# Altium schematic sheet TS808.SchDoc
size 381 x 152 mm
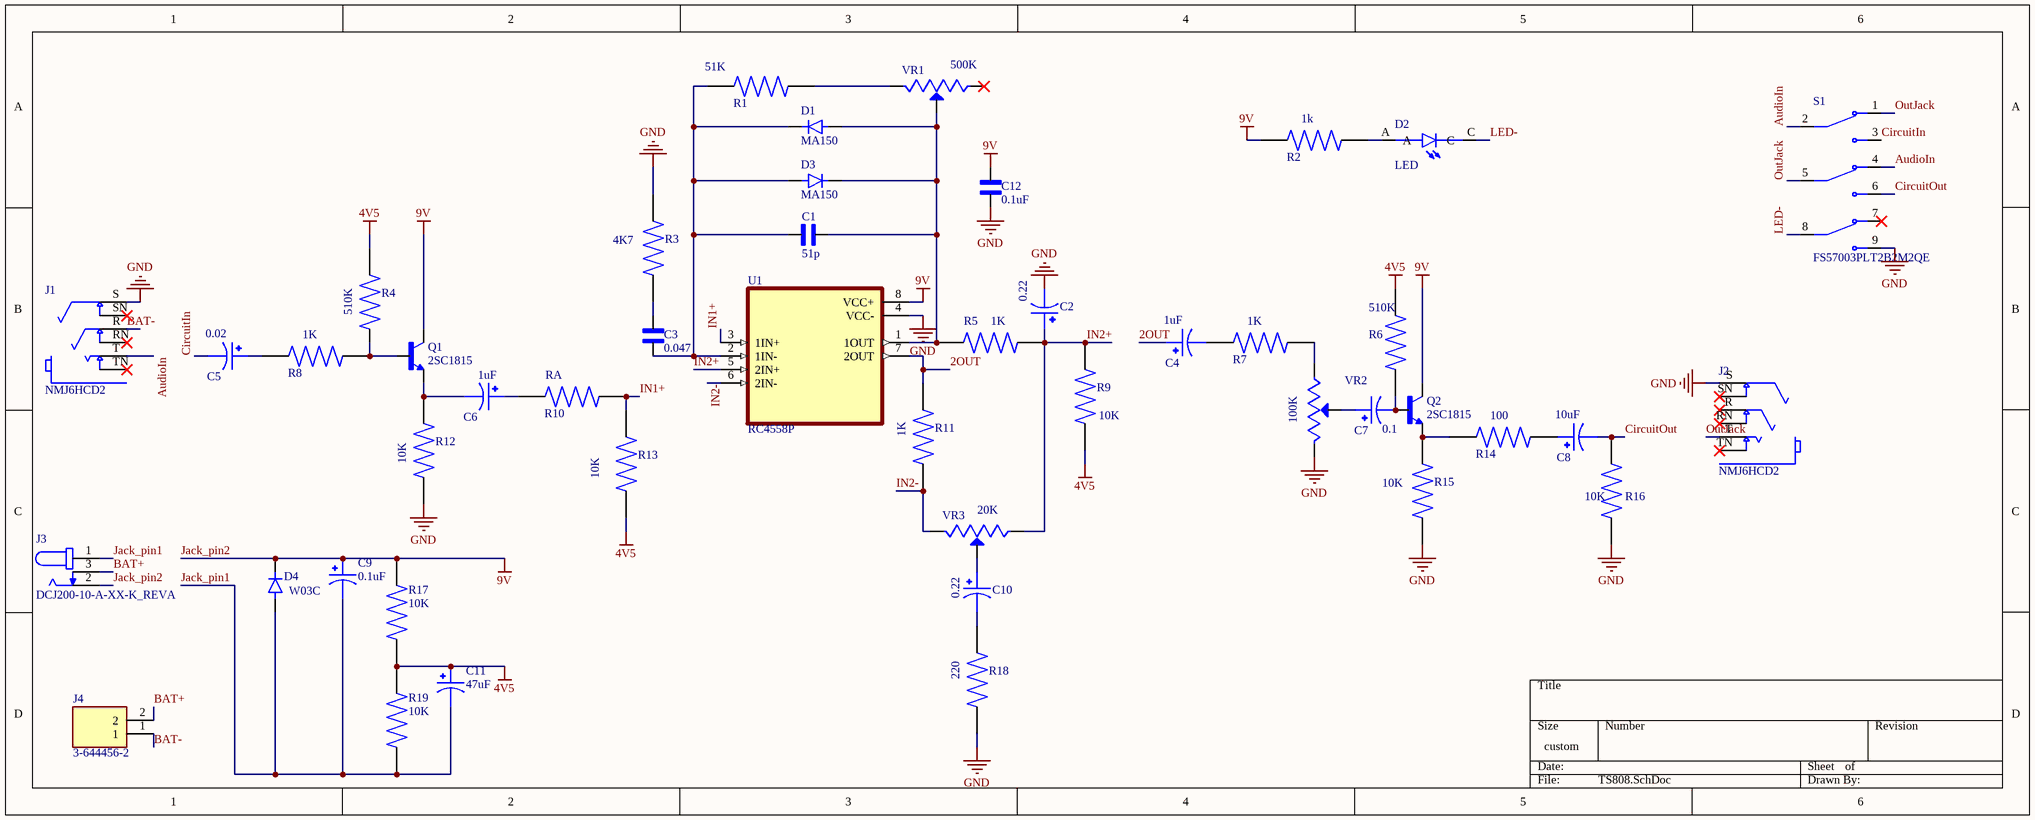
[diagram p0: TS808.SchDoc]

## Parts
C1  51p  [CAPRB500W50L400T250H550]
C2  0.22  [CAPPRD200W50D550H1250]
C3  0.047  [CAPRB500W50L400T250H550]
C4  1uF  [CAPPRD200W50D550H1250]
C5  0.02  [CAPPRD200W50D550H1250]
C6  1uF  [CAPPRD200W50D550H1250]
C7  0.1  [CAPPRD200W50D550H1250]
C8  10uF  [CAPPRD200W50D550H1250]
C9  0.1uF  [CAPPRD200W50D550H1250]
C10  0.22  [CAPPRD200W50D550H1250]
C11  47uF  [CAPPRD200W50D550H1250]
C12  0.1uF  [CAPRB500W50L400T250H550]
D1  MA150  [DIOAD1036W78L470D235]
D2  LED  [LED_WP7113ID]
D3  MA150  [DIOAD1036W78L470D235]
D4  W03C  [DIOAD1036W78L470D235]
J1  NMJ6HCD2  [NEUTRIK_NMJ6HCD2]
J2  NMJ6HCD2  [NEUTRIK_NMJ6HCD2]
J3  DCJ200-10-A-XX-K_REVA  [GCT_DCJ200-10-A-XX-K_REVA]
J4  3-644456-2  [TE_3-644456-2]
Q1  2SC1815  [TO92]
Q2  2SC1815  [TO92]
R1  51K  [RESAD1100W55L680D260]
R2  1k  [RESAD1100W55L680D260]
R3  4K7  [RESAD1100W55L680D260]
R4  510K  [RESAD1100W55L680D260]
R5  1K  [RESAD1100W55L680D260]
R6  510K  [RESAD1100W55L680D260]
R7  1K  [RESAD1100W55L680D260]
R8  1K  [RESAD1100W55L680D260]
R9  10K  [RESAD1100W55L680D260]
R10  RA  [RESAD1100W55L680D260]
R11  1K  [RESAD1100W55L680D260]
R12  10K  [RESAD1100W55L680D260]
R13  10K  [RESAD1100W55L680D260]
R14  100  [RESAD1100W55L680D260]
R15  10K  [RESAD1100W55L680D260]
R16  10K  [RESAD1100W55L680D260]
R17  10K  [RESAD1100W55L680D260]
R18  220  [RESAD1100W55L680D260]
R19  10K  [RESAD1100W55L680D260]
S1  FS57003PLT2B2M2QE  [SW_FS57003PLT2B2M2QE]
U1  RC4558P  [DIP794W45P254L959H508Q8]
VR1  500K  [TRIM_3296W-1-101LF]
VR2  100K  [TRIM_3296W-1-101LF]
VR3  20K  [TRIM_3296W-1-101LF]

## Nets
4V5: C11.1 R4.1 R6.1 R9.2 R13.2 R17.1 R19.2
GND: C2.2 C12.1 J1.S J2.S R3.1 R12.2 R15.2 R16.2 R18.2 S1.9 U1.4(VCC-) VR2.3(CW)
Jack_pin2: C9.1 C12.2 D4.C(K) J3.2 Q1.2(C) Q2.2(C) R2.1 R17.2 U1.8(VCC+)  [also labelled 9V]
2OUT: C4.1 R11.1 U1.7(2OUT)
AudioIn: J1.T S1.2 S1.4
BAT+: J3.3 J4.2
BAT-: J1.R J4.1
CircuitIn: C5.2 S1.3
CircuitOut: C8.2 R16.1 S1.6
IN1+: R10.1 R13.1 U1.3(1IN+)
IN2+: C2.1 R5.1 R9.1 U1.5(2IN+) VR3.1(CCW)
IN2-: R11.2 U1.6(2IN-) VR3.3(CW)
Jack_pin1: C9.2 C11.2 D4.A J3.1 R19.1
LED-: D2.C S1.8
OutJack: J2.T S1.1 S1.5
NetC1_1: C1.1 C3.1 D1.C(K) D3.A R1.2 U1.2(1IN-)
NetC1_2: C1.2 D1.A D3.C(K) R5.2 U1.1(1OUT) VR1.2(WIPER)
NetC3_2: C3.2 R3.2
NetC4_2: C4.2 R7.1
NetC5_1: C5.1 R8.2
NetC6_1: C6.1 R10.2
NetC6_2: C6.2 Q1.1(E) R12.1
NetC7_1: C7.1 VR2.2(WIPER)
NetC7_2: C7.2 Q2.3(B) R6.2
NetC8_1: C8.1 R14.2
NetC10_1: C10.1 VR3.2(WIPER)
NetC10_2: C10.2 R18.1
NetD2_A: D2.A R2.2
NetQ1_3: Q1.3(B) R4.2 R8.1
NetQ2_1: Q2.1(E) R14.1 R15.1
NetR1_1: R1.1 VR1.3(CW)
NetR7_2: R7.2 VR2.1(CCW)

Not connected (* = marked no-connect by the designer): J1 RN* SN* TN*; J2 R* RN* SN* TN*; S1 7*; VR1 1(CCW)*

## Library data of the parts
C1 C3 C12 = FG28C0G1H330JNT06: 33 pF Â±5% 50V Ceramic Capacitor C0G, NP0 Radial; MF: TDK; SnapEDA_Link: https://www.snapeda.com/parts/FG28C0G1H330JNT06/TDK/view-part/?ref=snap; Package: RADIAL-2 TDK; Value: *; MP: FG28C0G1H330JNT06; Check_prices: https://www.snapeda.com/parts/FG28C0G1H330JNT06/TDK/view-part/?ref=eda
C2 C4-C11 = UVR1A470MDD: 47 ÂµF 10 V Aluminum Electrolytic Capacitors Radial, Can - 2000 Hrs @ 85Â°C; MF: Nichicon; SnapEDA_Link: https://www.snapeda.com/parts/UVR1A470MDD/Nichicon/view-part/?ref=snap; Package: RADIAL-2 NICHICON; Value: *; MP: UVR1A470MDD; Check_prices: https://www.snapeda.com/parts/UVR1A470MDD/Nichicon/view-part/?ref=eda
D1 D3 D4 = 1N5819: 1A, 40V, Planar Schottky; MF: Taiwan Semiconductor; SnapEDA_Link: https://www.snapeda.com/parts/1N5819/taiwan/view-part/?ref=snap; Package: DO-41-2 Taiwan Semiconductor; Value: *; MP: 1N5819; Check_prices: https://www.snapeda.com/parts/1N5819/taiwan/view-part/?ref=eda
D2 = WP7113ID: Red 617nm LED Indication - Discrete 2V Radial; MF: Kingbright; Price: None; MP: WP7113ID; Package: Radial Kingbright; Check_prices: https://www.snapeda.com/parts/WP7113ID/Kingbright/view-part/?ref=eda; Purchase-URL: https://pricing.snapeda.com/search/part/WP7113ID/?ref=eda; Availability: In Stock; Value: *; SnapEDA_Link: https://www.snapeda.com/parts/WP7113ID/Kingbright/view-part/?ref=snap
J1 J2 = NMJ6HCD2: 1/4 stereo jack, switched, with chrome ferrule and straight PCB pins, mounting nut included; MF: Neutrik; Value: *; Check_prices: https://www.snapeda.com/parts/NMJ6HCD2/Neutrik/view-part/?ref=eda; MP: NMJ6HCD2; Price: None; Purchase-URL: https://pricing.snapeda.com/search/part/NMJ6HCD2/?ref=eda; Availability: In Stock; Package: None; SnapEDA_Link: https://www.snapeda.com/parts/NMJ6HCD2/Neutrik/view-part/?ref=snap
J3 = DCJ200-10-A-XX-K_REVA: Power Barrel Connector Jack 2.05mm ID (0.081), 5.50mm OD (0.217) Through Hole, Right Angle; MF: Global Connector Technology; MP: DCJ200-10-A-K1-K; SnapEDA_Link: https://www.snapeda.com/parts/DCJ200-10-A-K1-K/Global+Connector+Technology/view-part/?ref=snap; Package: None; Value: *; Check_prices: https://www.snapeda.com/parts/DCJ200-10-A-K1-K/Global+Connector+Technology/view-part/?ref=eda
J4 = 3-644456-2: HEADER ASSEMBLY, NARROW, MTA-100, 2 POSITION, STRAIGHT | TE Connectivity 3-644456-2; SnapEDA_Link: https://www.snapeda.com/parts/3-644456-2/TE+Connectivity+AMP+Connectors/view-part/?ref=snap; Package: None; Value: *; MF: TE Connectivity; MP: 3-644456-2; Check_prices: https://www.snapeda.com/parts/3-644456-2/TE+Connectivity+AMP+Connectors/view-part/?ref=eda
Q1 Q2 = 2SC1815: TRANS NPN ECB 150mA 60V TO-92; MF: Lumimax Optoelectronic Technology; SnapEDA_Link: https://www.snapeda.com/parts/2SC1815/Techno/view-part/?ref=snap; Package: None; Value: *; MP: 2SC1815; Check_prices: https://www.snapeda.com/parts/2SC1815/Techno/view-part/?ref=eda
R1-R19 = MFR-25FBF52-10K: 10.2 kOhms Â±1% 0.25W, 1/4W Through Hole Resistor Axial - Metal Film; MF: Yageo; SnapEDA_Link: https://www.snapeda.com/parts/MFR-25FBF52-10K/Yageo/view-part/?ref=snap; Package: RADIAL-2 YAGEO; Value: *; MP: MFR-25FBF52-10K; Check_prices: https://www.snapeda.com/parts/MFR-25FBF52-10K/Yageo/view-part/?ref=eda
S1 = FS57003PLT2B2M2QE: PUSHBUTTON, 1A, 9VDC 3PDT, On-On, Panel Mount, Rear; MF: e-switch inc; SnapEDA_Link: https://www.snapeda.com/parts/FS57003PLT2B2M2QE/E-Switch/view-part/?ref=snap; Package: None; Value: *; MP: FS57003PLT2B2M2QE; Check_prices: https://www.snapeda.com/parts/FS57003PLT2B2M2QE/E-Switch/view-part/?ref=eda
U1 = RC4558P: Dual, 30-V, 3-MHz, low noise (8-nV/âˆšHz) operational amplifier; MF: Texas Instruments; SnapEDA_Link: https://www.snapeda.com/parts/RC4558P/Texas+Instruments/view-part/?ref=snap; Package: PDIP-8 Texas; Value: *; MP: RC4558P; Check_prices: https://www.snapeda.com/parts/RC4558P/Texas+Instruments/view-part/?ref=eda
VR1-VR3 = 3296W-1-101LF: 3/8 Sq, Thru-Hole, TRIMMER, 100 ohms, Cermet, 25 Turns, Pwr-Rtg 0.5W | Bourns 3296W-1-101LF; SnapEDA_Link: https://www.snapeda.com/parts/3296W-1-101LF/Bourns/view-part/?ref=snap; Package: NON STANDARD-3 Bourns; Value: *; MF: Bourns; MP: 3296W-1-101LF; Check_prices: https://www.snapeda.com/parts/3296W-1-101LF/Bourns/view-part/?ref=eda